# Altium schematic sheet Inputs.SchDoc
size A4
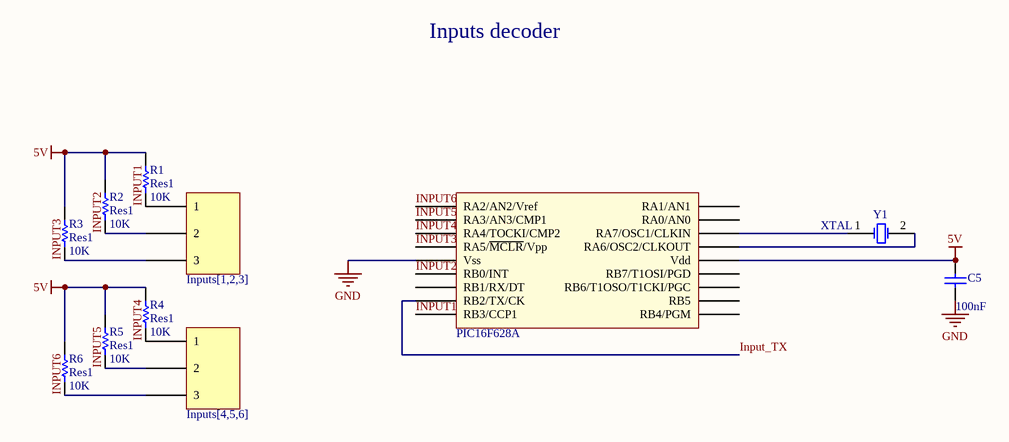
[diagram p0: Inputs.SchDoc]

## Parts
C5  value 100nF  [CeramicalCapacitor]  (hidden comment: Cap)
Inputs[1,2,3]  klema  [klema3]  (value not drawn)
Inputs[4,5,6]  klema  [klema3]  (value not drawn)
PIC16F628A  Microcontroller  [DIP18]  (value not drawn)
R1  Res1  value 10K  [AXIAL-0.3]
R2  Res1  value 10K  [AXIAL-0.3]
R3  Res1  value 10K  [AXIAL-0.3]
R4  Res1  value 10K  [AXIAL-0.3]
R5  Res1  value 10K  [AXIAL-0.3]
R6  Res1  value 10K  [AXIAL-0.3]
Y1  XTAL  [Kristal]

## Nets
5V: C5.2 PIC16F628A.14(Vdd) R1.2 R2.2 R3.2 R4.2 R5.2 R6.2
GND: C5.1 PIC16F628A.5(Vss)
INPUT1: Inputs[1,2,3].1 PIC16F628A.9(RB3/CCP1) R1.1
INPUT2: Inputs[1,2,3].2 PIC16F628A.6(RB0/INT) R2.1
INPUT3: Inputs[1,2,3].3 PIC16F628A.4(RA5/~{MCLR}/Vpp) R3.1
INPUT4: Inputs[4,5,6].1 PIC16F628A.3(RA4/TOCKI/CMP2) R4.1
INPUT5: Inputs[4,5,6].2 PIC16F628A.2(RA3/AN3/CMP1) R5.1
INPUT6: Inputs[4,5,6].3 PIC16F628A.1(RA2/AN2/Vref) R6.1
Input_TX: PIC16F628A.8(RB2/TX/CK)
NetPIC16F628A_15: PIC16F628A.15(RA6/OSC2/CLKOUT) Y1.2(OSC2)
NetPIC16F628A_16: PIC16F628A.16(RA7/OSC1/CLKIN) Y1.1(OSC1)

Not connected (* = marked no-connect by the designer): PIC16F628A 7(RB1/RX/DT) 10(RB4/PGM) 11(RB5) 12(RB6/T1OSO/T1CKI/PGC) 13(RB7/T1OSI/PGD) 17(RA0/AN0) 18(RA1/AN1)

## Notes on the sheet
- Inputs decoder

## Library data of the parts
C5 = Cap: Capacitor; Published: 8-Jun-2000; LatestRevisionDate: 17-Jul-2002; LatestRevisionNote: Re-released for DXP Platform.; PackageReference: RAD-0.3; Publisher: Altium Limited; PackageDescription: Radial Cap, Thru-Hole; 2 Leads; 0.3 in Pin Spacing
Inputs[1,2,3] Inputs[4,5,6] = klema3
PIC16F628A = PIC16F628A: Microcontroller PIC16F628A
R1-R6 = Res1: Resistor; Published: 8-Jun-2000; LatestRevisionDate: 17-Jul-2002; LatestRevisionNote: Re-released for DXP Platform.; PackageReference: AXIAL-0.3; Publisher: Altium Limited; PackageDescription: Axial Device, Thru-Hole; 2 Leads; 0.3 in Pin Spacing
Y1 = XTAL: Crystal Oscillator; Published: 8-Jun-2000; LatestRevisionDate: 17-Jul-2002; LatestRevisionNote: Re-released for DXP Platform.; PackageReference: R38; Publisher: Altium Limited; PackageDescription: Crystal, Thru-Hole; 2 Leads; Body 3.1 x 8.2 mm (Dia.xH)